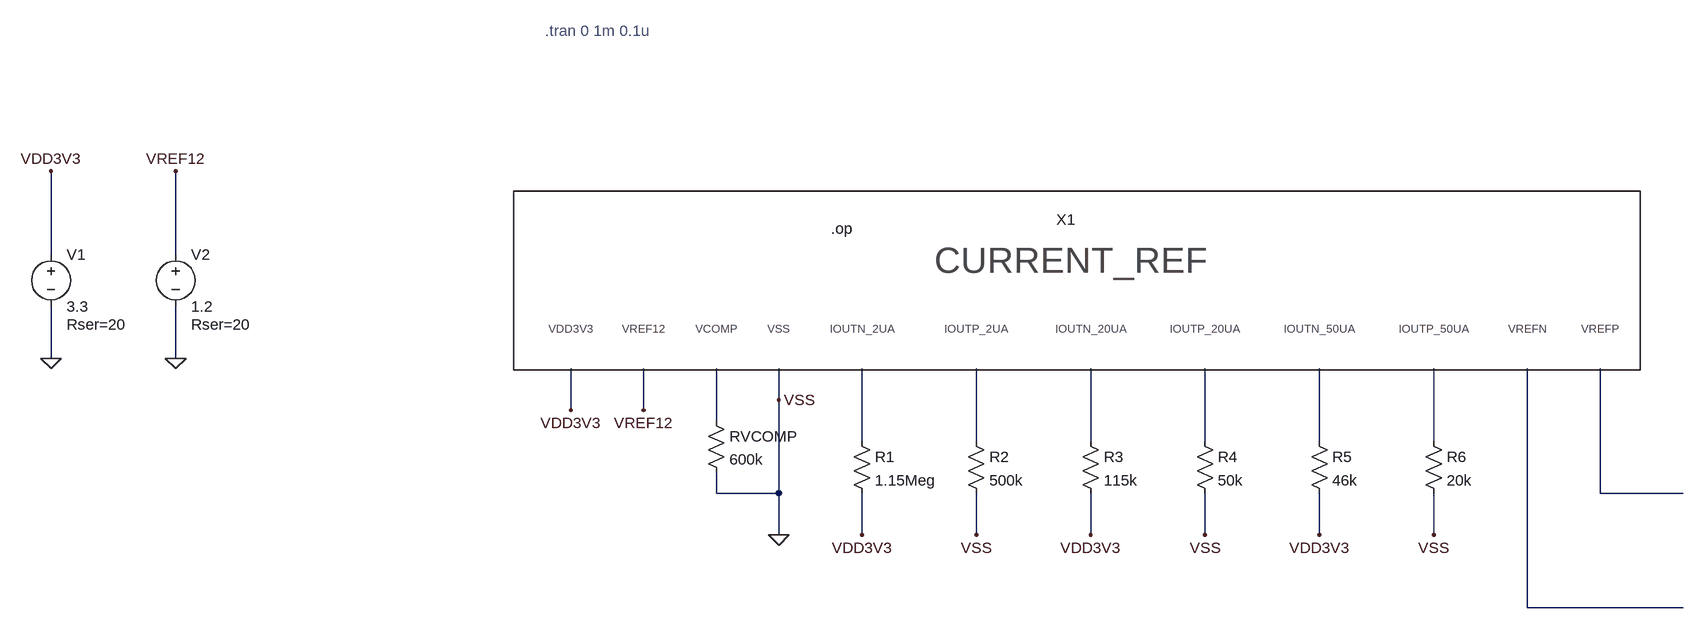
[diagram p0: schematic TB_Tran.asc]
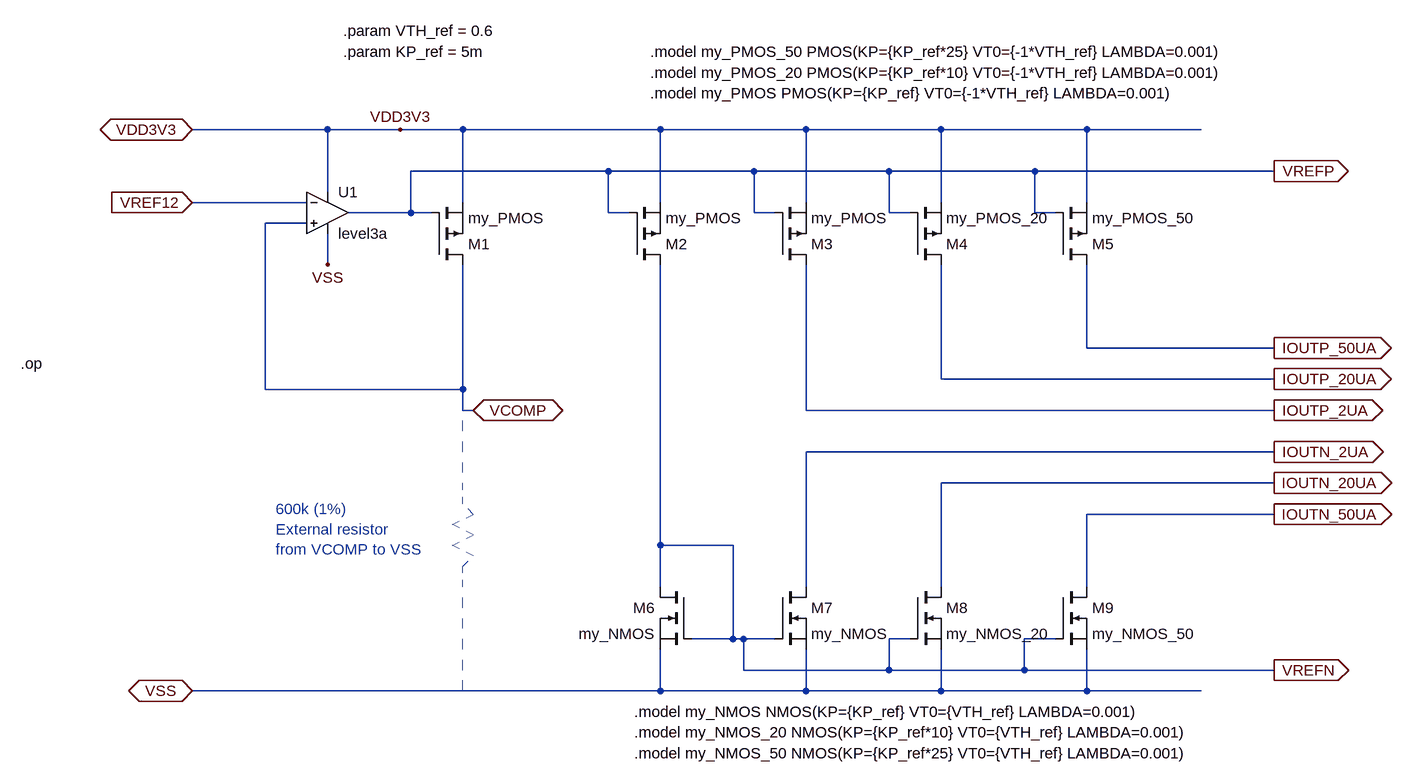
[diagram p1: sub-circuit current_ref.asc]
TB_Tran.asc, the LTspice schematic file:
Version 4.1
SHEET 1 1296 680
WIRE -1296 -32 -1296 -160
WIRE -1104 -32 -1104 -160
WIRE -1296 128 -1296 48
WIRE -1104 128 -1104 48
WIRE -176 192 -176 144
WIRE -496 208 -496 144
WIRE -384 208 -384 144
WIRE -272 224 -272 144
WIRE -48 256 -48 144
WIRE 128 256 128 144
WIRE 304 256 304 144
WIRE 480 256 480 144
WIRE 656 256 656 144
WIRE 832 256 832 144
WIRE -272 336 -272 304
WIRE -176 336 -176 192
WIRE -176 336 -272 336
WIRE 1088 336 1088 144
WIRE 1216 336 1088 336
WIRE -176 400 -176 336
WIRE -48 400 -48 336
WIRE 128 400 128 336
WIRE 304 400 304 336
WIRE 480 400 480 336
WIRE 656 400 656 336
WIRE 832 400 832 336
WIRE 976 512 976 144
WIRE 1216 512 976 512
FLAG -1296 128 0
FLAG -1104 128 0
FLAG -1296 -160 VDD3V3
FLAG -496 208 VDD3V3
FLAG -1104 -160 VREF12
FLAG -384 208 VREF12
FLAG -176 400 0
FLAG -176 192 VSS
FLAG 128 400 VSS
FLAG 480 400 VSS
FLAG 832 400 VSS
FLAG -48 400 VDD3V3
FLAG 304 400 VDD3V3
FLAG 656 400 VDD3V3
DATAFLAG 832 224 ""
DATAFLAG 656 208 ""
DATAFLAG 480 224 ""
DATAFLAG 304 208 ""
DATAFLAG 128 208 ""
DATAFLAG -48 192 ""
DATAFLAG 1200 336 ""
DATAFLAG 1200 512 ""
SYMBOL Current_Ref 272 -32 R0
SYMATTR InstName X1
SYMBOL voltage -1296 -48 R0
WINDOW 123 0 0 Left 0
WINDOW 39 24 124 Left 2
SYMATTR InstName V1
SYMATTR Value 3.3
SYMATTR SpiceLine Rser=20
SYMBOL voltage -1104 -48 R0
WINDOW 123 0 0 Left 0
WINDOW 39 24 124 Left 2
SYMATTR InstName V2
SYMATTR Value 1.2
SYMATTR SpiceLine Rser=20
SYMBOL res -288 208 R0
SYMATTR InstName RVCOMP
SYMATTR Value 600k
SYMATTR SpiceLine tol=5
SYMBOL res -64 240 R0
SYMATTR InstName R1
SYMATTR Value 1.15Meg
SYMBOL res 112 240 R0
SYMATTR InstName R2
SYMATTR Value 500k
SYMBOL res 288 240 R0
SYMATTR InstName R3
SYMATTR Value 115k
SYMBOL res 464 240 R0
SYMATTR InstName R4
SYMATTR Value 50k
SYMBOL res 640 240 R0
SYMATTR InstName R5
SYMATTR Value 46k
SYMBOL res 816 240 R0
SYMATTR InstName R6
SYMATTR Value 20k
TEXT -536 -376 Left 2 ;.tran 0 1m 0.1u
TEXT -96 -72 Left 2 !.op

current_ref.asc, the sub-circuit schematic file:
Version 4.1
SHEET 1 2068 1040
WIRE 400 32 192 32
WIRE 512 32 400 32
WIRE 608 32 512 32
WIRE 912 32 608 32
WIRE 1136 32 912 32
WIRE 1344 32 1136 32
WIRE 1568 32 1344 32
WIRE 1744 32 1568 32
WIRE 832 96 528 96
WIRE 1056 96 832 96
WIRE 1264 96 1056 96
WIRE 1488 96 1264 96
WIRE 1856 96 1488 96
WIRE 400 128 400 32
WIRE 368 144 192 144
WIRE 608 144 608 32
WIRE 912 144 912 32
WIRE 1136 144 1136 32
WIRE 1344 144 1344 32
WIRE 1568 144 1568 32
WIRE 528 160 528 96
WIRE 528 160 432 160
WIRE 560 160 528 160
WIRE 832 160 832 96
WIRE 864 160 832 160
WIRE 1056 160 1056 96
WIRE 1088 160 1056 160
WIRE 1264 160 1264 96
WIRE 1296 160 1264 160
WIRE 1488 160 1488 96
WIRE 1520 160 1488 160
WIRE 368 176 304 176
WIRE 400 240 400 192
WIRE 1568 368 1568 240
WIRE 1856 368 1568 368
WIRE 1344 416 1344 240
WIRE 1856 416 1344 416
WIRE 304 432 304 176
WIRE 608 432 608 240
WIRE 608 432 304 432
WIRE 608 464 608 432
WIRE 624 464 608 464
WIRE 1136 464 1136 240
WIRE 1856 464 1136 464
WIRE 1856 528 1136 528
WIRE 1856 576 1344 576
WIRE 1856 624 1568 624
WIRE 912 672 912 240
WIRE 1024 672 912 672
WIRE 912 736 912 672
WIRE 1136 736 1136 528
WIRE 1344 736 1344 576
WIRE 1568 736 1568 624
WIRE 1024 816 1024 672
WIRE 1024 816 960 816
WIRE 1040 816 1024 816
WIRE 1088 816 1040 816
WIRE 1296 816 1264 816
WIRE 1520 816 1472 816
WIRE 1040 864 1040 816
WIRE 1264 864 1264 816
WIRE 1264 864 1040 864
WIRE 1472 864 1472 816
WIRE 1472 864 1264 864
WIRE 1856 864 1472 864
WIRE 912 896 912 832
WIRE 912 896 192 896
WIRE 1136 896 1136 832
WIRE 1136 896 912 896
WIRE 1344 896 1344 832
WIRE 1344 896 1136 896
WIRE 1568 896 1568 832
WIRE 1568 896 1344 896
WIRE 1744 896 1568 896
FLAG 192 32 VDD3V3
IOPIN 192 32 BiDir
FLAG 192 144 VREF12
IOPIN 192 144 In
FLAG 624 464 VCOMP
IOPIN 624 464 BiDir
FLAG 192 896 VSS
IOPIN 192 896 BiDir
FLAG 1856 528 IOUTN_2UA
IOPIN 1856 528 Out
FLAG 1856 576 IOUTN_20UA
IOPIN 1856 576 Out
FLAG 1856 624 IOUTN_50UA
IOPIN 1856 624 Out
FLAG 1856 464 IOUTP_2UA
IOPIN 1856 464 Out
FLAG 1856 416 IOUTP_20UA
IOPIN 1856 416 Out
FLAG 1856 368 IOUTP_50UA
IOPIN 1856 368 Out
FLAG 512 32 VDD3V3
FLAG 1856 96 VREFP
IOPIN 1856 96 Out
FLAG 1856 864 VREFN
IOPIN 1856 864 Out
FLAG 400 240 VSS
DATAFLAG 496 160 ""
DATAFLAG 1632 368 ""
DATAFLAG 1584 416 ""
DATAFLAG 1568 464 ""
DATAFLAG 1568 464 ""
DATAFLAG 1520 528 ""
DATAFLAG 1520 576 ""
DATAFLAG 1600 624 ""
DATAFLAG 912 256 ""
SYMBOL OpAmps\\UniversalOpAmp3 400 160 R0
SYMATTR InstName U1
SYMBOL pmos 560 240 M180
SYMATTR InstName M1
SYMATTR Value my_PMOS
SYMBOL pmos 864 240 M180
SYMATTR InstName M2
SYMATTR Value my_PMOS
SYMBOL pmos 1088 240 M180
SYMATTR InstName M3
SYMATTR Value my_PMOS
SYMBOL pmos 1296 240 M180
SYMATTR InstName M4
SYMATTR Value my_PMOS_20
SYMBOL pmos 1520 240 M180
SYMATTR InstName M5
SYMATTR Value my_PMOS_50
SYMBOL nmos 960 736 M0
SYMATTR InstName M6
SYMATTR Value my_NMOS
SYMBOL nmos 1088 736 R0
SYMATTR InstName M7
SYMATTR Value my_NMOS
SYMBOL nmos 1296 736 R0
SYMATTR InstName M8
SYMATTR Value my_NMOS_20
SYMBOL nmos 1520 736 R0
SYMATTR InstName M9
SYMATTR Value my_NMOS_50
TEXT 872 928 Left 2 !.model my_NMOS NMOS(KP={KP_ref} VT0={VTH_ref} LAMBDA=0.001)
TEXT 896 -24 Left 2 !.model my_PMOS PMOS(KP={KP_ref} VT0={-1*VTH_ref} LAMBDA=0.001)
TEXT 896 -56 Left 2 !.model my_PMOS_20 PMOS(KP={KP_ref*10} VT0={-1*VTH_ref} LAMBDA=0.001)
TEXT 896 -88 Left 2 !.model my_PMOS_50 PMOS(KP={KP_ref*25} VT0={-1*VTH_ref} LAMBDA=0.001)
TEXT 872 960 Left 2 !.model my_NMOS_20 NMOS(KP={KP_ref*10} VT0={VTH_ref} LAMBDA=0.001)
TEXT 872 992 Left 2 !.model my_NMOS_50 NMOS(KP={KP_ref*25} VT0={VTH_ref} LAMBDA=0.001)
TEXT 320 616 Left 2 ;600k (1%) \nExternal resistor\nfrom VCOMP to VSS
TEXT 424 -88 Left 2 !.param KP_ref = 5m
TEXT 424 -120 Left 2 !.param VTH_ref = 0.6
TEXT -72 392 Left 2 !.op
LINE Normal 608 496 608 480 2
LINE Normal 608 496 608 496 2
LINE Normal 608 496 608 496 2
LINE Normal 608 528 608 512 2
LINE Normal 608 528 608 528 2
LINE Normal 608 560 608 544 2
LINE Normal 608 608 608 576 2
LINE Normal 624 624 608 608 2
LINE Normal 592 640 624 624 2
LINE Normal 624 656 592 640 2
LINE Normal 592 672 624 656 2
LINE Normal 624 688 592 672 2
LINE Normal 608 704 624 688 2
LINE Normal 608 736 608 704 2
LINE Normal 608 736 608 736 2
LINE Normal 608 768 608 752 2
LINE Normal 608 768 608 768 2
LINE Normal 608 768 608 768 2
LINE Normal 608 800 608 784 2
LINE Normal 608 800 608 800 2
LINE Normal 608 832 608 816 2
LINE Normal 608 864 608 848 2
LINE Normal 608 864 608 864 2
LINE Normal 608 896 608 880 2

The netlist it stands for:
* TB_Tran.asc
X§X1 VDD3V3 VREF12 N001 0 N002 N003 N004 N005 N006 N007 N009 N008 current_ref
V1 VDD3V3 0 3.3 Rser=20
V2 VREF12 0 1.2 Rser=20
RVCOMP N001 0 600k tol=5
R1 N002 VDD3V3 1.15Meg
R2 N003 0 500k
R3 N004 VDD3V3 115k
R4 N005 0 50k
R5 N006 VDD3V3 46k
R6 N007 0 20k

* block symbol definitions
.subckt current_ref VDD3V3 VREF12 VCOMP VSS IOUTN_2UA IOUTP_2UA IOUTN_20UA IOUTP_20UA IOUTN_50UA IOUTP_50UA VREFN VREFP
X§U1 VCOMP VREF12 VDD3V3 VSS VREFP level3a  ; pins In+ In- V+ V- OUT
M1 VCOMP VREFP VDD3V3 VDD3V3 my_PMOS
M2 VREFN VREFP VDD3V3 VDD3V3 my_PMOS
M3 IOUTP_2UA VREFP VDD3V3 VDD3V3 my_PMOS
M4 IOUTP_20UA VREFP VDD3V3 VDD3V3 my_PMOS_20
M5 IOUTP_50UA VREFP VDD3V3 VDD3V3 my_PMOS_50
M6 VREFN VREFN VSS VSS my_NMOS
M7 IOUTN_2UA VREFN VSS VSS my_NMOS
M8 IOUTN_20UA VREFN VSS VSS my_NMOS_20
M9 IOUTN_50UA VREFN VSS VSS my_NMOS_50
.model my_NMOS NMOS(KP={KP_ref} VT0={VTH_ref} LAMBDA=0.001)
.model my_PMOS PMOS(KP={KP_ref} VT0={-1*VTH_ref} LAMBDA=0.001)
.model my_PMOS_20 PMOS(KP={KP_ref*10} VT0={-1*VTH_ref} LAMBDA=0.001)
.model my_PMOS_50 PMOS(KP={KP_ref*25} VT0={-1*VTH_ref} LAMBDA=0.001)
.model my_NMOS_20 NMOS(KP={KP_ref*10} VT0={VTH_ref} LAMBDA=0.001)
.model my_NMOS_50 NMOS(KP={KP_ref*25} VT0={VTH_ref} LAMBDA=0.001)
* 600k (1%)
* External resistor
* from VCOMP to VSS
.param KP_ref = 5m
.param VTH_ref = 0.6
.op
.ends current_ref

.model NMOS NMOS
.model PMOS PMOS
.lib standard.mos
* .tran 0 1m 0.1u
.op
.backanno
.end